# Altium schematic sheet Input_Filter.SchDoc
size A4
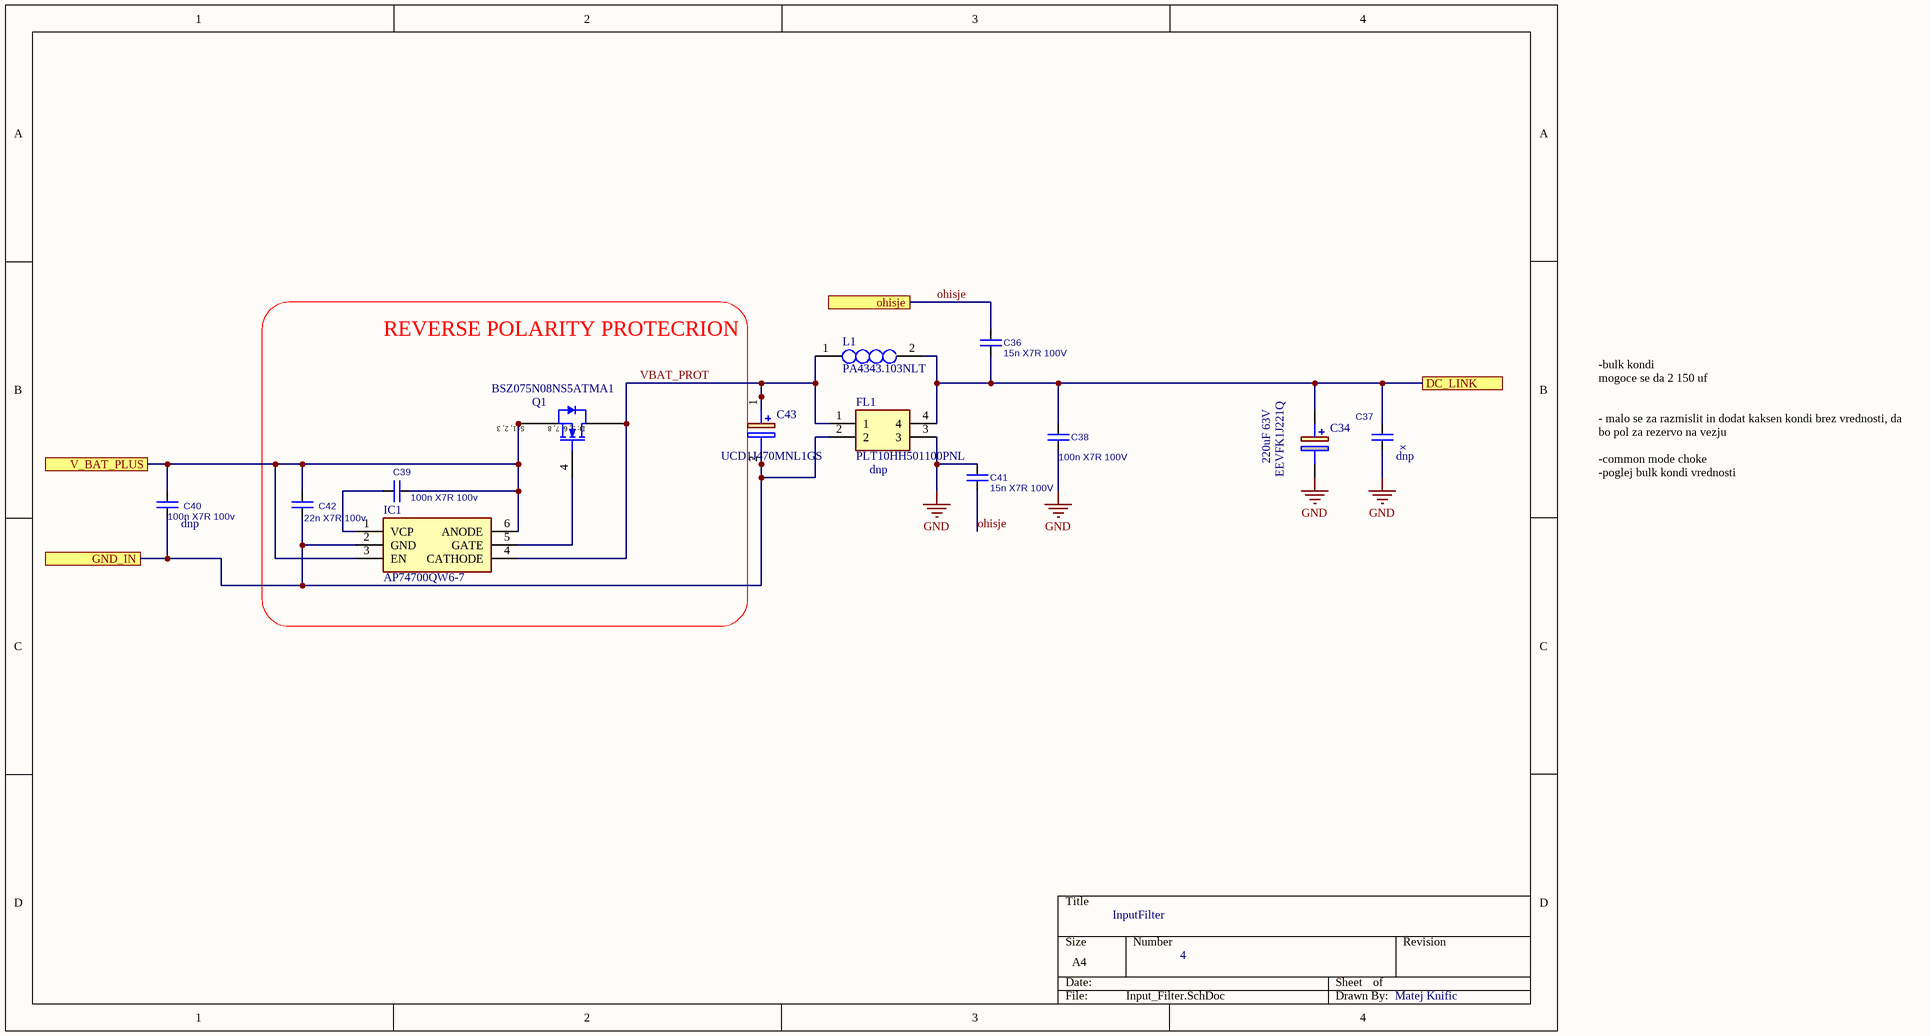
[diagram p0: Input_Filter.SchDoc]

## Parts
C34  EEVFK1J221Q  vrednost: 220uF 63V  [EEEFK0J332AQ]
C36  15n X7R 100V  [C0603]
C37  Parameter 1: dnp  [C0603]  (hidden comment: x)
C38  100n X7R 100V  [C0603]
C39  100n X7R 100v  [C0603]
C40  Parameter 1: dnp  [C0603]  (hidden comment: 100n X7R 100v)
C41  15n X7R 100V  [C0603]
C42  22n X7R 100v  [C0603]
C43  UCD1J470MNL1GS  [EEETC1V470P]
FL1  PLT10HH501100PNL  Parameter 1: dnp  [PLT10HH101150PNL]
IC1  AP74700QW6-7  [SOT95P285X140-6N]
L1  PA4343.103NLT  [PA4343103NLT]
Q1  BSZ075N08NS5ATMA1  [BSZ075N08NS5ATMA1]

## Blocks framed on the sheet
REVERSE POLARITY PROTECRION: C39 C42 IC1 Q1

## Ports
DC_LINK, GND_IN, ohisje, V_BAT_PLUS

## Nets
GND: C34.2(-) C37.2 C38.2 C41.1 FL1.3
DC_LINK: C34.1(+) C36.2 C37.1 C38.1 FL1.4 L1.2 ; port DC_LINK
GND_IN: C40.2 C42.2 C43.2(-) FL1.2 IC1.2(GND) ; port GND_IN
ohisje: C36.1 C41.2 ; port ohisje
V_BAT_PLUS: C39.1 C40.1 C42.1 IC1.3(EN) IC1.6(ANODE) Q1.1(S) Q1.2(S) Q1.3(S) Q1.10(S) ; port V_BAT_PLUS
VBAT_PROT: C43.1(+) FL1.1 IC1.4(CATHODE) L1.1 Q1.5(D) Q1.6(D) Q1.7(D) Q1.8(D) Q1.9(D)
NetC39_2: C39.2 IC1.1(VCP)
NetIC1_5: IC1.5(GATE) Q1.4(G)

## Notes on the sheet
- -bulk kondi
  mogoce se da 2 150 uf
  - malo se za razmislit in dodat kaksen kondi brez vrednosti, da bo pol za rezervo na vezju
  -common mode choke
  -poglej bulk kondi vrednosti
- InputFilter
- 4
- Matej Knific
- (in symbol BSZ075N08NS5ATMA1) S: 1, 2, 3; D: 5, 6, 7, 8

## Library data of the parts
C34 = EEVFK1J221Q: Panasonic Aluminium Electrolytic Capacitor 220uF 63V dc 12.5mm Surface Mount FK SMD Series +105C; Geometry.Height: 15mm; Manufacturer_Name: Panasonic; Manufacturer_Part_Number: EEVFK1J221Q; Mouser Part Number: *; Mouser Price/Stock: *; Arrow Part Number: *; Arrow Price/Stock: *; Datasheet Link: http://industrial.panasonic.com/cdbs/www-data/pdf/RDE0000/ABA0000C1181.pdf
C36-C42 = C: Capacitor
  C36 C41: Value: 15n X7R 100V
  C37: Value: x
  C38: Value: 100n X7R 100V
  C39 C40: Value: 100n X7R 100v
  C42: Value: 22n X7R 100v
C43 = EEE-FK1J470L: Capacitor Polarised / UCD1J470MNL1GS!!!!; Manufacturer_Part_Number: UCD1J470MNL1GS
FL1 = PLT10HH501100PNL: Filter; Manufacturer_Name: Murata Electronics; Datasheet Link: https://www.murata.com/en-us/products/productdetail?partno=PLT10HH501100PN%23; Height: 9.4mm; Manufacturer_Part_Number: PLT10HH501100PNL; Mouser Part Number: 81-PLT10HH501100PNL; Mouser Price/Stock: https://www.mouser.co.uk/ProductDetail/Murata-Electronics/PLT10HH501100PNL?qs=UOUhb9503hEfTgGbug4ocA%3D%3D; Arrow Part Number: PLT10HH501100PNL; Arrow Price/Stock: https://www.arrow.com/en/products/plt10hh501100pnl/murata-manufacturing?region=nac
IC1 = AP74700QW6-7: Integrated Circuit; Manufacturer_Name: Diodes Incorporated; Datasheet Link: https://www.diodes.com//assets/Datasheets/AP74700Q.pdf; Height: 1.4mm; Manufacturer_Part_Number: AP74700QW6-7; Mouser Part Number: 621-AP74700QW6-7; Mouser Price/Stock: https://www.mouser.co.uk/ProductDetail/Diodes-Incorporated/AP74700QW6-7?qs=vvQtp7zwQdPsSFAXTBJZqQ%3D%3D; Arrow Part Number: AP74700QW6-7; Arrow Price/Stock: https://www.arrow.com/en/products/ap74700qw6-7/diodes-incorporated?utm_currency=USD&region=europe
L1 = PA4343.103NLT: Inductor; Manufacturer_Name: Yageo Group; Datasheet Link: https://datasheet.datasheetarchive.com/originals/distributors/DKDS-10/182394.pdf; Height: 6.5mm; Manufacturer_Part_Number: PA4343.103NLT; Mouser Part Number: 673-PA4343.103NLT; Mouser Price/Stock: https://www.mouser.co.uk/ProductDetail/Pulse-Electronics/PA4343.103NLT?qs=%2FzQKu7YvIMb8arzTB%2FvZ4w%3D%3D; Arrow Part Number: PA4343.103NLT; Arrow Price/Stock: https://www.arrow.com/en/products/pa4343.103nlt/pulse-electronics-corporation?region=nac
Q1 = BSZ075N08NS5ATMA1: ComponentLink1Description: Mouser; ComponentLink1URL: https://eu.mouser.com/ProductDetail/Infineon-Technologies/BSZ075N08NS5ATMA1?qs=3Bi3m9r5MQbCecwbz%252BCetA%3D%3D; ComponentLink2Description: Octopart; ComponentLink2URL: https://octopart.com/part/infineon/BSZ075N08NS5ATMA1